# Altium schematic sheet Logic.schdoc
size A; SheetNumber: 3; SheetTotal: 5
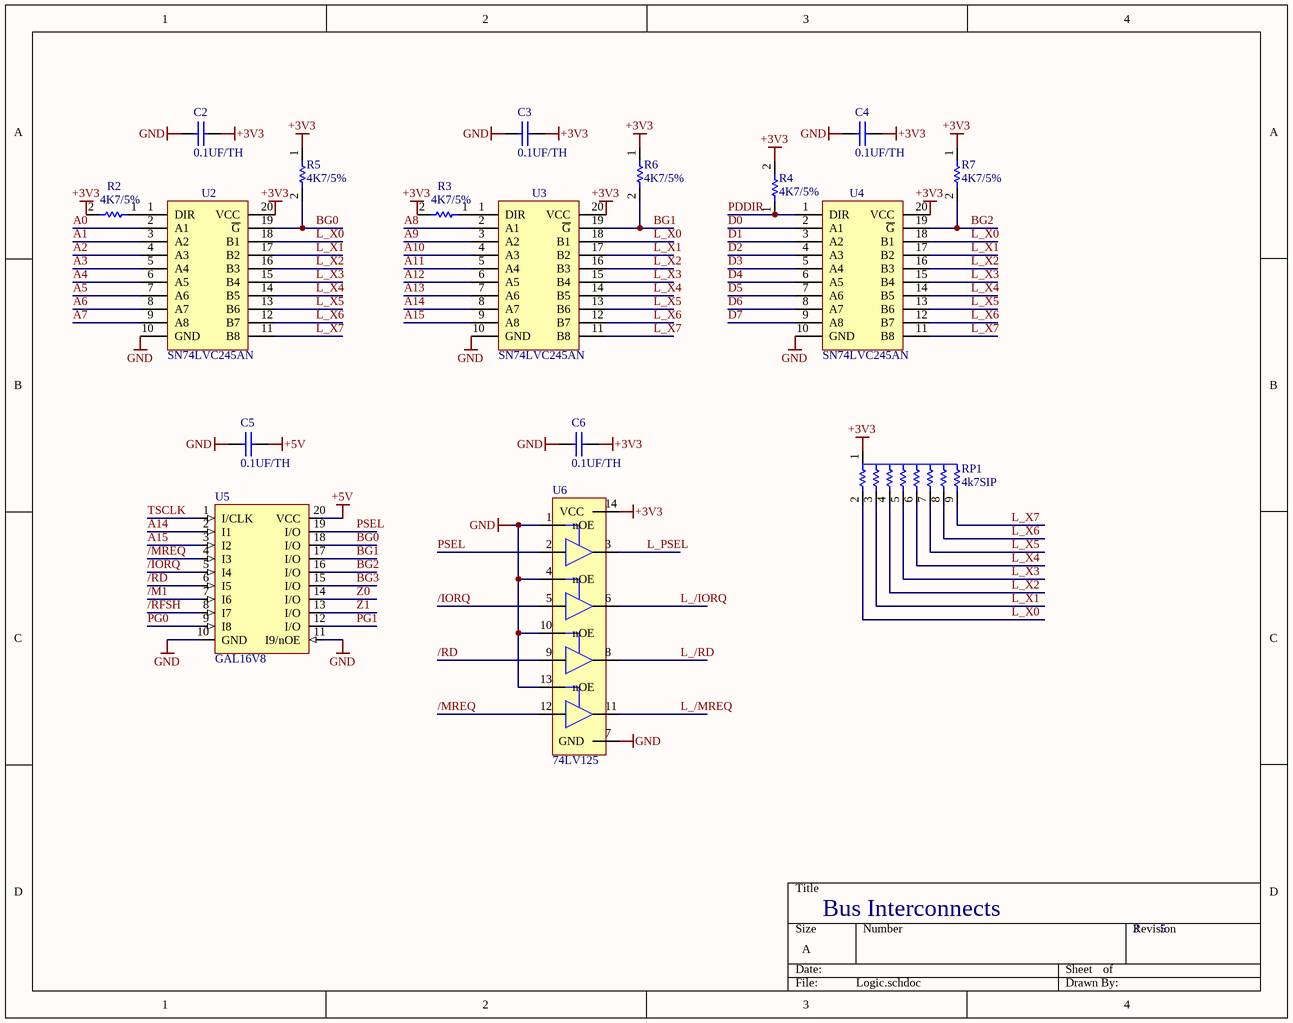
[diagram p0: Logic.schdoc]

## Parts
C2  0.1UF/TH  [CAPH5]
C3  0.1UF/TH  [CAPH5]
C4  0.1UF/TH  [CAPH5]
C5  0.1UF/TH  [CAPH5]
C6  0.1UF/TH  [CAPH5]
R2  4K7/5%  [CF18]
R3  4K7/5%  [CF18]
R4  4K7/5%  [CF18]
R5  4K7/5%  [CF18]
R6  4K7/5%  [CF18]
R7  4K7/5%  [CF18]
RP1  4k7SIP  [SIP9]
U2  SN74LVC245AN  [DIP20]
U3  SN74LVC245AN  [DIP20]
U4  SN74LVC245AN  [DIP20]
U5  GAL16V8  [DIP20]
U6  74LV125  [dip14]

## Nets
+3V3: C2.2 C3.2 C4.2 C6.2 R2.2 R3.2 R4.2 R5.1 R6.1 R7.1 RP1.1 U2.20(VCC) U3.20(VCC) U4.20(VCC) U6.14(VCC)
+5V: C5.2 U5.20(VCC)
GND: C2.1 C3.1 C4.1 C5.1 C6.1 U2.10(GND) U3.10(GND) U4.10(GND) U5.10(GND) U5.11(I9/nOE) U6.1(nOE) U6.4(nOE) U6.7(GND) U6.10(nOE) U6.13(nOE)
/IORQ: U5.5(I4) U6.5
/M1: U5.7(I6)
/MREQ: U5.4(I3) U6.12
/RD: U5.6(I5) U6.9
/RFSH: U5.8(I7)
A0: U2.2(A1)
A1: U2.3(A2)
A2: U2.4(A3)
A3: U2.5(A4)
A4: U2.6(A5)
A5: U2.7(A6)
A6: U2.8(A7)
A7: U2.9(A8)
A8: U3.2(A1)
A9: U3.3(A2)
A10: U3.4(A3)
A11: U3.5(A4)
A12: U3.6(A5)
A13: U3.7(A6)
A14: U3.8(A7) U5.2(I1)
A15: U3.9(A8) U5.3(I2)
BG0: R5.2 U2.19(~{G}) U5.18(I/O)
BG1: R6.2 U3.19(~{G}) U5.17(I/O)
BG2: R7.2 U4.19(~{G}) U5.16(I/O)
BG3: U5.15(I/O)
D0: U4.2(A1)
D1: U4.3(A2)
D2: U4.4(A3)
D3: U4.5(A4)
D4: U4.6(A5)
D5: U4.7(A6)
D6: U4.8(A7)
D7: U4.9(A8)
L_/IORQ: U6.6
L_/MREQ: U6.11
L_/RD: U6.8
L_PSEL: U6.3
L_X0: RP1.2 U2.18(B1) U3.18(B1) U4.18(B1)
L_X1: RP1.3 U2.17(B2) U3.17(B2) U4.17(B2)
L_X2: RP1.4 U2.16(B3) U3.16(B3) U4.16(B3)
L_X3: RP1.5 U2.15(B4) U3.15(B4) U4.15(B4)
L_X4: RP1.6 U2.14(B5) U3.14(B5) U4.14(B5)
L_X5: RP1.7 U2.13(B6) U3.13(B6) U4.13(B6)
L_X6: RP1.8 U2.12(B7) U3.12(B7) U4.12(B7)
L_X7: RP1.9 U2.11(B8) U3.11(B8) U4.11(B8)
PDDIR: R4.1 U4.1(DIR)
PG0: U5.9(I8)
PG1: U5.12(I/O)
PSEL: U5.19(I/O) U6.2
TSCLK: U5.1(I/CLK)
Z0: U5.14(I/O)
Z1: U5.13(I/O)
NetR2_1: R2.1 U2.1(DIR)
NetR3_1: R3.1 U3.1(DIR)

## Notes on the sheet
- Bus Interconnects

## Library data of the parts
C2-C6 = 0.1UF/TH: 0.1 µF ±10% 50V Ceramic Capacitor X7R Radial; MFG: Vishay; MFG PN: K104K10X7RF5UH5; DK PN: BC2665CT-ND; Price: 1.17
R2-R7 = 4K7/5%: RES 4.7K OHM 5% 1/8W AXIAL; MFG PN: CF18JT4K70; DK PN: CF18JT4K70CT-ND; MFG: Stackpole; Populate: *
RP1 = 4k7SIP: 4.7k Ohm ±2% 200mW Power Per Element Bussed Resistor Network/Array ±100ppm/°C 9-SIP; MFG: Bournes; MFG PN: 4609X-101-472LF; DK PN: 4609X-101-472LF-ND; Populate: *
U2-U4 = SN74LVC245AN: Transceiver, Non-Inverting 1 Element 8 Bit per Element 3-State Output 20-PDIP; MFG: TI; DK PN: 296-8503-5-ND; MFG PN: SN74LVC245AN; Price: 1.17
U5 = GAL16V8: GAL16V8 Programmable Logic Device (PLD) IC 8 Macrocells 20-PDIP; MFG: Microchip; MFG PN: ATF16V8C-7PU; Price: 1.17; MFG PN 2: ATF16V8CZ-15PU
U6 = 74LV125: Buffer, Non-Inverting 4 Element 1 Bit per Element 3-State Output 14-SOIC; MFG: TI; MFG PN: SN74LV125AN; DK PN: 296-34037-5-ND; Price: 1.17